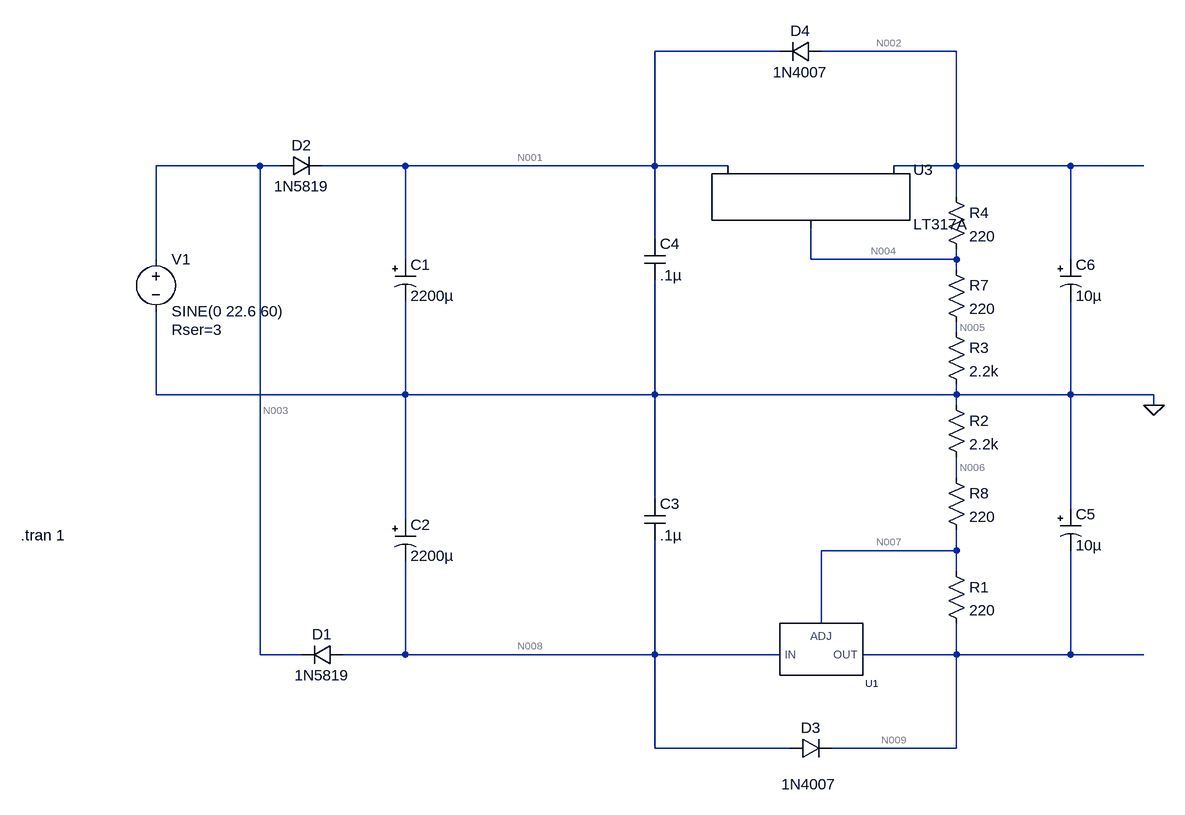
[diagram p0: schematic ACtoRails.asc]
ACtoRails.asc, the LTspice schematic file:
Version 4.1
SHEET 1 1768 1020
WIRE 928 -336 736 -336
WIRE 1200 -336 992 -336
WIRE 128 -160 -32 -160
WIRE 160 -160 128 -160
WIRE 352 -160 224 -160
WIRE 736 -160 736 -336
WIRE 736 -160 352 -160
WIRE 848 -160 736 -160
WIRE 1200 -160 1200 -336
WIRE 1200 -160 1104 -160
WIRE 1376 -160 1200 -160
WIRE 1488 -160 1376 -160
WIRE 1200 -112 1200 -160
WIRE 736 -48 736 -160
WIRE -32 -16 -32 -160
WIRE 352 -16 352 -160
WIRE 976 -16 976 -64
WIRE 1200 -16 1200 -32
WIRE 1200 -16 976 -16
WIRE 1376 -16 1376 -160
WIRE 1200 0 1200 -16
WIRE 1200 96 1200 80
WIRE -32 192 -32 64
WIRE 352 192 352 48
WIRE 352 192 -32 192
WIRE 736 192 736 16
WIRE 736 192 352 192
WIRE 1200 192 1200 176
WIRE 1200 192 736 192
WIRE 1376 192 1376 48
WIRE 1376 192 1200 192
WIRE 1504 192 1376 192
WIRE 1200 208 1200 192
WIRE 1504 208 1504 192
WIRE 1200 320 1200 288
WIRE 736 352 736 192
WIRE 1376 368 1376 192
WIRE 352 384 352 192
WIRE 1200 432 1200 400
WIRE 1200 432 992 432
WIRE 1200 464 1200 432
WIRE 992 544 992 432
WIRE 128 592 128 -160
WIRE 192 592 128 592
WIRE 352 592 352 448
WIRE 352 592 256 592
WIRE 736 592 736 416
WIRE 736 592 352 592
WIRE 928 592 736 592
WIRE 1200 592 1200 544
WIRE 1200 592 1056 592
WIRE 1376 592 1376 432
WIRE 1376 592 1200 592
WIRE 1488 592 1376 592
WIRE 736 736 736 592
WIRE 944 736 736 736
WIRE 1200 736 1200 592
WIRE 1200 736 1008 736
FLAG 1504 208 0
SYMBOL voltage -32 -32 R0
WINDOW 123 0 0 Left 0
WINDOW 39 24 124 Left 2
SYMATTR SpiceLine Rser=3
SYMATTR InstName V1
SYMATTR Value SINE(0 22.6 60)
SYMBOL diode 256 576 R90
WINDOW 0 0 32 VBottom 2
WINDOW 3 32 32 VTop 2
SYMATTR InstName D1
SYMATTR Value 1N5819
SYMBOL diode 160 -144 R270
WINDOW 0 32 32 VTop 2
WINDOW 3 0 32 VBottom 2
SYMATTR InstName D2
SYMATTR Value 1N5819
SYMBOL polcap 336 -16 R0
SYMATTR InstName C1
SYMATTR Value 2200µ
SYMBOL polcap 336 384 R0
SYMATTR InstName C2
SYMATTR Value 2200µ
SYMBOL PowerProducts\\LT317A 976 -160 R0
SYMATTR InstName U3
SYMBOL LM337 992 592 M180
SYMATTR InstName U1
SYMBOL diode 944 752 R270
WINDOW 0 32 32 VTop 2
WINDOW 3 -24 29 VBottom 2
SYMATTR InstName D3
SYMATTR Value 1N4007
SYMBOL diode 992 -352 R90
WINDOW 0 0 32 VBottom 2
WINDOW 3 32 32 VTop 2
SYMATTR InstName D4
SYMATTR Value 1N4007
SYMBOL cap 720 352 R0
SYMATTR InstName C3
SYMATTR Value .1µ
SYMBOL cap 720 -48 R0
SYMATTR InstName C4
SYMATTR Value .1µ
SYMBOL res 1184 192 R0
SYMATTR InstName R2
SYMATTR Value 2.2k
SYMBOL res 1184 80 R0
SYMATTR InstName R3
SYMATTR Value 2.2k
SYMBOL res 1184 -128 R0
SYMATTR InstName R4
SYMATTR Value 220
SYMBOL res 1184 448 R0
SYMATTR InstName R1
SYMATTR Value 220
SYMBOL polcap 1360 368 R0
SYMATTR InstName C5
SYMATTR Value 10µ
SYMBOL polcap 1360 -16 R0
SYMATTR InstName C6
SYMATTR Value 10µ
SYMBOL res 1184 -16 R0
SYMATTR InstName R7
SYMATTR Value 220
SYMBOL res 1184 304 R0
SYMATTR InstName R8
SYMATTR Value 220
TEXT -240 408 Left 2 !.tran 1

The netlist it stands for:
* ACtoRails.asc
V1 N003 0 SINE(0 22.6 60) Rser=3
D1 N008 N003 1N5819
D2 N003 N001 1N5819
C1 N001 0 2200µ
C2 0 N008 2200µ
X§U3 N004 N002 N001 LT317A
X§U1 N008 N007 N009 LM337  ; pins IN ADJ OUT
D3 N008 N009 1N4007
D4 N002 N001 1N4007
C3 0 N008 .1µ
C4 N001 0 .1µ
R2 0 N006 2.2k
R3 N005 0 2.2k
R4 N002 N004 220
R1 N007 N009 220
C5 0 N009 10µ
C6 N002 0 10µ
R7 N004 N005 220
R8 N006 N007 220
.model D D
.lib standard.dio
.tran 1
.lib LTC.lib
.lib LM337.sub
.backanno
.end

* Results of the author's LTspice run, read from the files saved beside the schematic
* Operating Point, zero values left out:
*   V(n001) = 124.2 µV
*   V(n002) = -7.741 µV
*   V(n003) = 120.9 µV
*   V(n004) = -7.096 µV
*   V(n005) = -6.451 µV
*   V(n006) = 54.31 mV
*   V(n007) = 59.74 mV
*   V(n008) = 29.26 mV
*   V(n009) = 50.87 mV
*   I(D1) = 40.31 µA
*   I(D2) = -2.932 nA
*   I(D3) = -40.47 pA
*   I(R1) = 40.31 µA
*   I(R2) = -24.69 µA
*   I(R3) = -2.932 nA
*   I(R4) = -2.932 nA
*   I(R7) = -2.932 nA
*   I(R8) = -24.69 µA
*   I(V1) = 40.32 µA
*   Ix(u1:1) = -65 µA
*   Ix(u1:19) = 40.31 µA
*   Ix(u1:8) = -40.31 µA
*   Ix(u3:2) = 2.933 nA
*   Ix(u3:3) = -2.933 nA
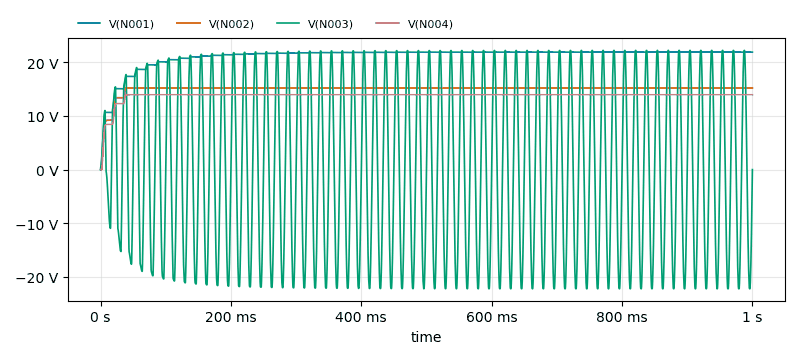
[diagram p1: Transient Analysis of ACtoRails.asc, plotted from the saved traces]
* Transient Analysis, 1 run:
*   V(N001): min 124.2 µV, max 21.93 V, average 21.18 V, rms 21.29 V, last 21.89 V
*   V(N002): min -7.741 µV, max 15.24 V, average 15.01 V, rms 15.06 V, last 15.2 V
*   V(N003): min -22.21 V, max 22.22 V, average 242.5 µV, rms 15.72 V, last 0 V
*   V(N004): min -7.096 µV, max 13.98 V, average 13.77 V, rms 13.81 V, last 13.94 V